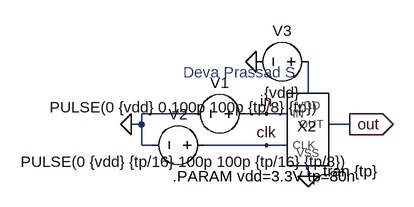
[diagram p0: schematic shift_reg_tb.asc]
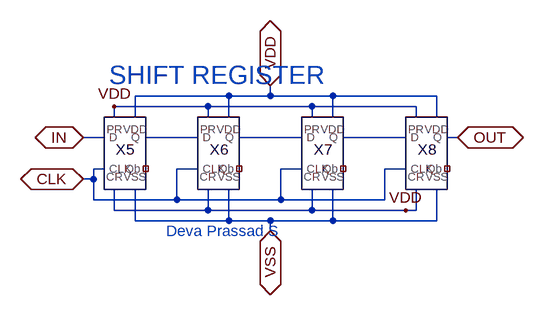
[diagram p1: sub-circuit shift_reg.asc]
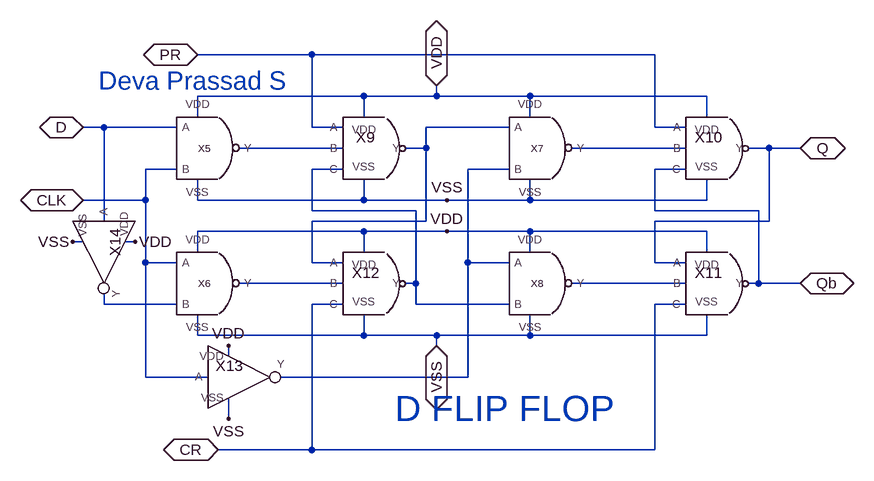
[diagram p2: sub-circuit dff_with_pc.asc]
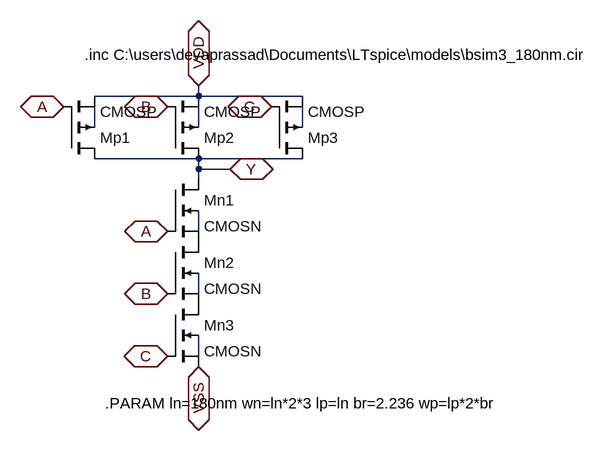
[diagram p3: sub-circuit nand3.asc]
shift_reg_tb.asc, the LTspice schematic file:
Version 4.1
SHEET 1 880 680
WIRE 208 112 208 64
WIRE 32 144 -48 144
WIRE 144 144 112 144
WIRE 176 144 144 144
WIRE -48 160 -48 144
WIRE -48 160 -64 160
WIRE 272 160 240 160
WIRE -48 192 -48 160
WIRE -32 192 -48 192
WIRE 144 192 48 192
WIRE 176 192 144 192
WIRE 208 240 208 224
FLAG -64 160 0
FLAG 208 240 0
FLAG 272 160 out
IOPIN 272 160 Out
FLAG 128 64 0
FLAG 144 144 in
FLAG 144 192 clk
SYMBOL voltage 128 144 R90
WINDOW 0 -32 56 VBottom 2
WINDOW 3 -26 108 VTop 2
WINDOW 123 0 0 Left 0
WINDOW 39 0 0 Left 0
SYMATTR InstName V1
SYMATTR Value PULSE(0 {vdd} 0 100p 100p {tp/8} {tp})
SYMBOL voltage 64 192 R90
WINDOW 0 -32 56 VBottom 2
WINDOW 3 10 43 VTop 2
SYMATTR InstName V2
SYMATTR Value PULSE(0 {vdd} {tp/16} 100p 100p {tp/16} {tp/8})
SYMBOL voltage 224 64 R90
WINDOW 0 -32 56 VBottom 2
WINDOW 3 32 56 VTop 2
WINDOW 123 0 0 Left 0
WINDOW 39 0 0 Left 0
SYMATTR InstName V3
SYMATTR Value {vdd}
SYMBOL shift_reg 208 192 R0
SYMATTR InstName X2
TEXT 0 240 Left 2 !.PARAM vdd=3.3V tp=80n
TEXT 224 232 Left 2 !.tran {tp}
TEXT 16 80 Left 2 ;Deva Prassad S

shift_reg.asc, the sub-circuit schematic file:
Version 4.1
SHEET 1 880 680
WIRE 128 80 -16 80
WIRE 192 80 192 64
WIRE 192 80 128 80
WIRE 288 80 192 80
WIRE 448 80 288 80
WIRE 96 96 -48 96
WIRE 256 96 96 96
WIRE 416 96 256 96
WIRE -48 112 -48 96
WIRE -16 112 -16 80
WIRE 96 112 96 96
WIRE 128 112 128 80
WIRE 256 112 256 96
WIRE 288 112 288 80
WIRE 416 112 416 96
WIRE 448 112 448 80
WIRE -64 144 -96 144
WIRE 80 144 0 144
WIRE 240 144 144 144
WIRE 400 144 304 144
WIRE 480 144 464 144
WIRE -64 192 -80 192
WIRE 80 192 48 192
WIRE 240 192 208 192
WIRE 400 192 368 192
WIRE -80 208 -80 192
WIRE -80 208 -96 208
WIRE -80 240 -80 208
WIRE 48 240 48 192
WIRE 48 240 -80 240
WIRE 208 240 208 192
WIRE 208 240 48 240
WIRE 368 240 368 192
WIRE 368 240 208 240
WIRE -48 256 -48 224
WIRE 96 256 96 224
WIRE 96 256 -48 256
WIRE 256 256 256 224
WIRE 256 256 96 256
WIRE 400 256 256 256
WIRE 416 256 416 224
WIRE 416 256 400 256
WIRE -16 272 -16 224
WIRE 128 272 128 224
WIRE 128 272 -16 272
WIRE 192 272 128 272
WIRE 288 272 288 224
WIRE 288 272 192 272
WIRE 448 272 448 224
WIRE 448 272 288 272
WIRE 192 288 192 272
FLAG 480 144 OUT
IOPIN 480 144 BiDir
FLAG -96 144 IN
IOPIN -96 144 BiDir
FLAG 192 288 VSS
IOPIN 192 288 BiDir
FLAG -96 208 CLK
IOPIN -96 208 BiDir
FLAG 192 64 VDD
IOPIN 192 64 BiDir
FLAG -48 96 VDD
FLAG 400 256 VDD
SYMBOL Dff_with_pc -32 192 R0
SYMATTR InstName X5
SYMBOL Dff_with_pc 112 192 R0
SYMATTR InstName X6
SYMBOL Dff_with_pc 272 192 R0
SYMATTR InstName X7
SYMBOL Dff_with_pc 432 192 R0
SYMATTR InstName X8
TEXT -56 48 Left 4 ;SHIFT REGISTER
TEXT 32 288 Left 2 ;Deva Prassad S

dff_with_pc.asc, the sub-circuit schematic file:
Version 4.1
SHEET 1 952 680
WIRE 144 -48 -32 -48
WIRE 672 -48 144 -48
WIRE 224 16 -32 16
WIRE 336 16 336 0
WIRE 336 16 224 16
WIRE 480 16 336 16
WIRE 752 16 480 16
WIRE -32 48 -32 16
WIRE 224 48 224 16
WIRE 480 48 480 16
WIRE 752 48 752 16
WIRE -176 64 -208 64
WIRE -64 64 -176 64
WIRE 144 64 144 -48
WIRE 192 64 144 64
WIRE 448 64 320 64
WIRE 672 64 672 -48
WIRE 720 64 672 64
WIRE 192 96 32 96
WIRE 320 96 320 64
WIRE 320 96 288 96
WIRE 720 96 544 96
WIRE 848 96 816 96
WIRE 896 96 848 96
WIRE -64 128 -112 128
WIRE 192 128 144 128
WIRE 448 128 384 128
WIRE 720 128 672 128
WIRE -112 176 -112 128
WIRE -112 176 -208 176
WIRE -32 176 -32 144
WIRE 224 176 224 144
WIRE 224 176 -32 176
WIRE 352 176 224 176
WIRE 480 176 480 144
WIRE 480 176 352 176
WIRE 752 176 752 144
WIRE 752 176 480 176
WIRE 144 192 144 128
WIRE 304 192 144 192
WIRE 672 192 672 128
WIRE 832 192 672 192
WIRE -176 208 -176 64
WIRE 320 208 320 96
WIRE 320 208 144 208
WIRE 848 208 848 96
WIRE 848 208 672 208
WIRE 224 224 -32 224
WIRE 352 224 224 224
WIRE 480 224 352 224
WIRE 752 224 480 224
WIRE -208 240 -224 240
WIRE -128 240 -144 240
WIRE -32 256 -32 224
WIRE 224 256 224 224
WIRE 480 256 480 224
WIRE 752 256 752 224
WIRE -112 272 -112 176
WIRE -64 272 -112 272
WIRE 144 272 144 208
WIRE 192 272 144 272
WIRE 384 272 384 128
WIRE 448 272 384 272
WIRE 672 272 672 208
WIRE 720 272 672 272
WIRE 192 304 32 304
WIRE 304 304 304 192
WIRE 304 304 288 304
WIRE 720 304 544 304
WIRE 832 304 832 192
WIRE 832 304 816 304
WIRE 896 304 832 304
WIRE -176 336 -176 320
WIRE -64 336 -176 336
WIRE 192 336 144 336
WIRE 304 336 304 304
WIRE 448 336 304 336
WIRE 720 336 672 336
WIRE -32 384 -32 352
WIRE 224 384 224 352
WIRE 224 384 -32 384
WIRE 336 384 224 384
WIRE 480 384 480 352
WIRE 480 384 336 384
WIRE 752 384 752 352
WIRE 752 384 480 384
WIRE 336 400 336 384
WIRE 16 416 16 400
WIRE -112 448 -112 272
WIRE -16 448 -112 448
WIRE 384 448 384 272
WIRE 384 448 96 448
WIRE 16 512 16 480
WIRE 144 560 144 336
WIRE 144 560 0 560
WIRE 672 560 672 336
WIRE 672 560 144 560
FLAG -208 64 D
IOPIN -208 64 BiDir
FLAG 896 96 Q
IOPIN 896 96 BiDir
FLAG 896 304 Qb
IOPIN 896 304 BiDir
FLAG -32 -48 PR
IOPIN -32 -48 BiDir
FLAG 0 560 CR
IOPIN 0 560 BiDir
FLAG 336 0 VDD
IOPIN 336 0 BiDir
FLAG 336 400 VSS
IOPIN 336 400 BiDir
FLAG -224 240 VSS
FLAG 352 176 VSS
FLAG 16 512 VSS
FLAG -128 240 VDD
FLAG 352 224 VDD
FLAG 16 400 VDD
FLAG -208 176 CLK
IOPIN -208 176 BiDir
SYMBOL diglib\\basic_cells\\nand1x\\nand1x -16 96 R0
SYMATTR InstName X5
SYMBOL diglib\\basic_cells\\nand1x\\nand1x -16 304 R0
SYMATTR InstName X6
SYMBOL diglib\\basic_cells\\nand1x\\nand1x 496 96 R0
SYMATTR InstName X7
SYMBOL diglib\\basic_cells\\nand1x\\nand1x 496 304 R0
SYMATTR InstName X8
SYMBOL diglib\\basic_cells\\nand1x\\nand3 256 128 R0
SYMATTR InstName X9
SYMBOL diglib\\basic_cells\\nand1x\\nand3 784 128 R0
SYMATTR InstName X10
SYMBOL diglib\\basic_cells\\nand1x\\nand3 784 336 R0
SYMATTR InstName X11
SYMBOL diglib\\basic_cells\\nand1x\\nand3 256 336 R0
SYMATTR InstName X12
SYMBOL diglib\\basic_cells\\inv1x\\inv1x 48 448 R0
SYMATTR InstName X13
SYMBOL diglib\\basic_cells\\inv1x\\inv1x -176 272 R90
SYMATTR InstName X14
TEXT 272 496 Left 5 ;D FLIP FLOP
TEXT -184 -8 Left 4 ;Deva Prassad S

nand3.asc, the sub-circuit schematic file:
Version 4.1
SHEET 1 880 680
WIRE 208 -64 208 -80
WIRE 208 -64 48 -64
WIRE 368 -64 208 -64
WIRE 48 -16 48 -48
WIRE 208 -16 208 -48
WIRE 368 -16 368 -48
WIRE 208 32 48 32
WIRE 368 32 208 32
WIRE 208 48 208 32
WIRE 256 48 208 48
WIRE 208 64 208 48
WIRE 208 144 208 112
WIRE 208 240 208 208
WIRE 208 336 208 304
FLAG 0 -48 A
IOPIN 0 -48 BiDir
FLAG 160 -48 B
IOPIN 160 -48 BiDir
FLAG 320 -48 C
IOPIN 320 -48 BiDir
FLAG 160 144 A
IOPIN 160 144 BiDir
FLAG 160 240 B
IOPIN 160 240 BiDir
FLAG 160 336 C
IOPIN 160 336 BiDir
FLAG 208 352 VSS
IOPIN 208 352 BiDir
FLAG 208 -80 VDD
IOPIN 208 -80 BiDir
FLAG 256 48 Y
IOPIN 256 48 BiDir
SYMBOL nmos4 160 64 R0
SYMATTR InstName Mn1
SYMATTR Value CMOSN
SYMATTR Value2 l={ln} w={wn} ad={ln*wn} as={ln*wn} pd={2*ln+wn} ps={2*ln+wn}
SYMBOL pmos4 0 32 M180
SYMATTR InstName Mp1
SYMATTR Value CMOSP
SYMATTR Value2 l={lp} w={wp} ad={lp*wp} as={lp*wp} pd={2*lp+wp} ps={2*lp+wp}
SYMBOL nmos4 160 160 R0
SYMATTR InstName Mn2
SYMATTR Value CMOSN
SYMATTR Value2 l={ln} w={wn} ad={ln*wn} as={ln*wn} pd={2*ln+wn} ps={2*ln+wn}
SYMBOL nmos4 160 256 R0
SYMATTR InstName Mn3
SYMATTR Value CMOSN
SYMATTR Value2 l={ln} w={wn} ad={ln*wn} as={ln*wn} pd={2*ln+wn} ps={2*ln+wn}
SYMBOL pmos4 160 32 M180
SYMATTR InstName Mp2
SYMATTR Value CMOSP
SYMATTR Value2 l={lp} w={wp} ad={lp*wp} as={lp*wp} pd={2*lp+wp} ps={2*lp+wp}
SYMBOL pmos4 320 32 M180
SYMATTR InstName Mp3
SYMATTR Value CMOSP
SYMATTR Value2 l={lp} w={wp} ad={lp*wp} as={lp*wp} pd={2*lp+wp} ps={2*lp+wp}
TEXT 32 -128 Left 2 !.inc C:\\users\\devaprassad\\Documents\\LTspice\\models\\bsim3_180nm.cir
TEXT 64 408 Left 2 !.PARAM ln=180nm wn=ln*2*3 lp=ln br=2.236 wp=lp*2*br

The netlist it stands for:
* shift_reg_tb.asc
V1 in 0 PULSE(0 {vdd} 0 100p 100p {tp/8} {tp})
V2 clk 0 PULSE(0 {vdd} {tp/16} 100p 100p {tp/16} {tp/8})
V3 N001 0 {vdd}
X§X2 clk in out N001 0 shift_reg

* block symbol definitions
.subckt shift_reg CLK IN OUT VDD VSS
X§X5 VDD IN VDD N001 NC_01 VDD VSS CLK dff_with_pc
X§X6 VDD N001 VDD N002 NC_02 VDD VSS CLK dff_with_pc
X§X7 VDD N002 VDD N003 NC_03 VDD VSS CLK dff_with_pc
X§X8 VDD N003 VDD OUT NC_04 VDD VSS CLK dff_with_pc
* SHIFT REGISTER
* Deva Prassad S
.ends shift_reg

.subckt dff_with_pc CR D PR Q Qb VDD VSS CLK
X§X5 N002 VDD VSS D CLK nand1x  ; pins Y VDD VSS A B
X§X6 N006 VDD VSS CLK N008 nand1x  ; pins Y VDD VSS A B
X§X7 N003 VDD VSS N001 N005 nand1x  ; pins Y VDD VSS A B
X§X8 N007 VDD VSS N005 N004 nand1x  ; pins Y VDD VSS A B
X§X9 PR N002 N004 VDD VSS N001 nand3
X§X10 PR N003 Qb VDD VSS Q nand3
X§X11 Q N007 CR VDD VSS Qb nand3
X§X12 N001 N006 CR VDD VSS N004 nand3
X§X13 CLK VDD VSS N005 inv1x  ; pins A VDD VSS Y
X§X14 D VDD VSS N008 inv1x  ; pins A VDD VSS Y
* D FLIP FLOP
* Deva Prassad S
.ends dff_with_pc

.subckt nand3 A B C VDD VSS Y
Mn1 Y A P001 N004 CMOSN l={ln} w={wn} ad={ln*wn} as={ln*wn} pd={2*ln+wn} ps={2*ln+wn}
Mp1 Y A VDD N001 CMOSP l={lp} w={wp} ad={lp*wp} as={lp*wp} pd={2*lp+wp} ps={2*lp+wp}
Mn2 P001 B P002 N005 CMOSN l={ln} w={wn} ad={ln*wn} as={ln*wn} pd={2*ln+wn} ps={2*ln+wn}
Mn3 P002 C VSS N006 CMOSN l={ln} w={wn} ad={ln*wn} as={ln*wn} pd={2*ln+wn} ps={2*ln+wn}
Mp2 Y B VDD N002 CMOSP l={lp} w={wp} ad={lp*wp} as={lp*wp} pd={2*lp+wp} ps={2*lp+wp}
Mp3 Y C VDD N003 CMOSP l={lp} w={wp} ad={lp*wp} as={lp*wp} pd={2*lp+wp} ps={2*lp+wp}
.inc C:\users\devaprassad\Documents\LTspice\models\bsim3_180nm.cir
.PARAM ln=180nm wn=ln*2*3 lp=ln br=2.236 wp=lp*2*br
.ends nand3

.model NMOS NMOS
.model PMOS PMOS
.lib standard.mos
.PARAM vdd=3.3V tp=80n
.tran {tp}
* Deva Prassad S
.backanno
.end